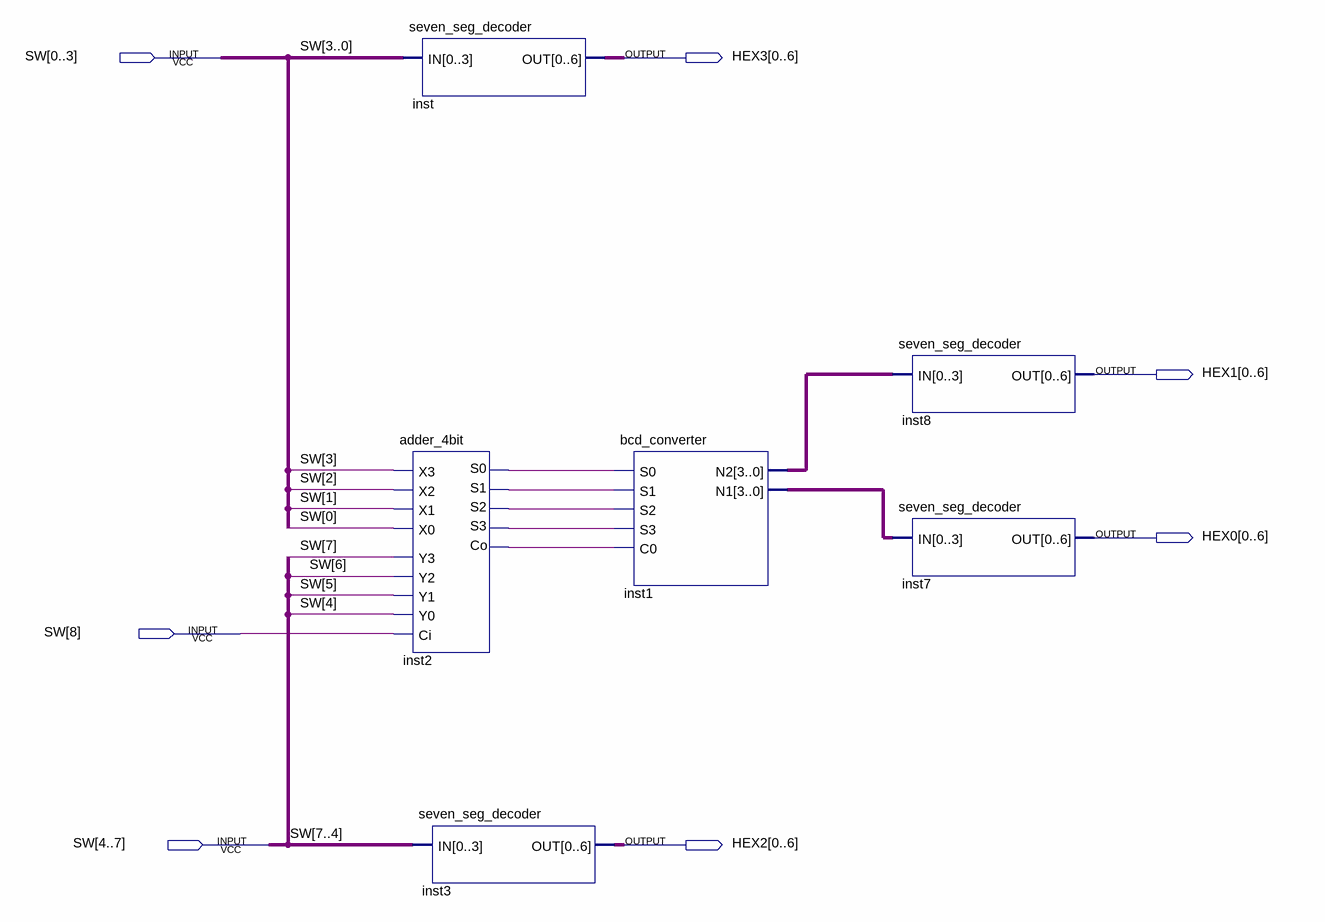
[diagram p0: schematic sheet]
// Quartus schematic lab06.bdf as structural Verilog: 6 symbols, 7 pins
module lab06 (
  input  [0:8] SW,
  output [0:6] HEX3,
  output [0:6] HEX1,
  output [0:6] HEX0,
  output [0:6] HEX2
);

  wire inst2_co, inst2_s0, inst2_s1, inst2_s2, inst2_s3;
  wire [3:0] inst1_n1, inst1_n2;

  seven_seg_decoder inst (.IN({SW[3], SW[2], SW[1], SW[0]}), .OUT(HEX3));
  adder_4bit inst2 (
    .X3(SW[3]), .Y3(SW[7]), .X2(SW[2]), .Y2(SW[6]), .X1(SW[1]), .Y1(SW[5]), .X0(SW[0]), .Y0(SW[4]),
    .Ci(SW[8]), .S0(inst2_s0), .S1(inst2_s1), .S2(inst2_s2), .S3(inst2_s3), .Co(inst2_co));
  seven_seg_decoder inst3 (.IN({SW[7], SW[6], SW[5], SW[4]}), .OUT(HEX2));
  bcd_converter inst1 (
    .S0(inst2_s0), .S1(inst2_s1), .S2(inst2_s2), .S3(inst2_s3), .C0(inst2_co), .N2(inst1_n2), .N1(inst1_n1));
  seven_seg_decoder inst8 (.IN(inst1_n2), .OUT(HEX1));
  seven_seg_decoder inst7 (.IN(inst1_n1), .OUT(HEX0));
endmodule
